# Altium schematic sheet 04_MCU_BLE.SchDoc
size A; SheetNumber: 3; SheetTotal: 6
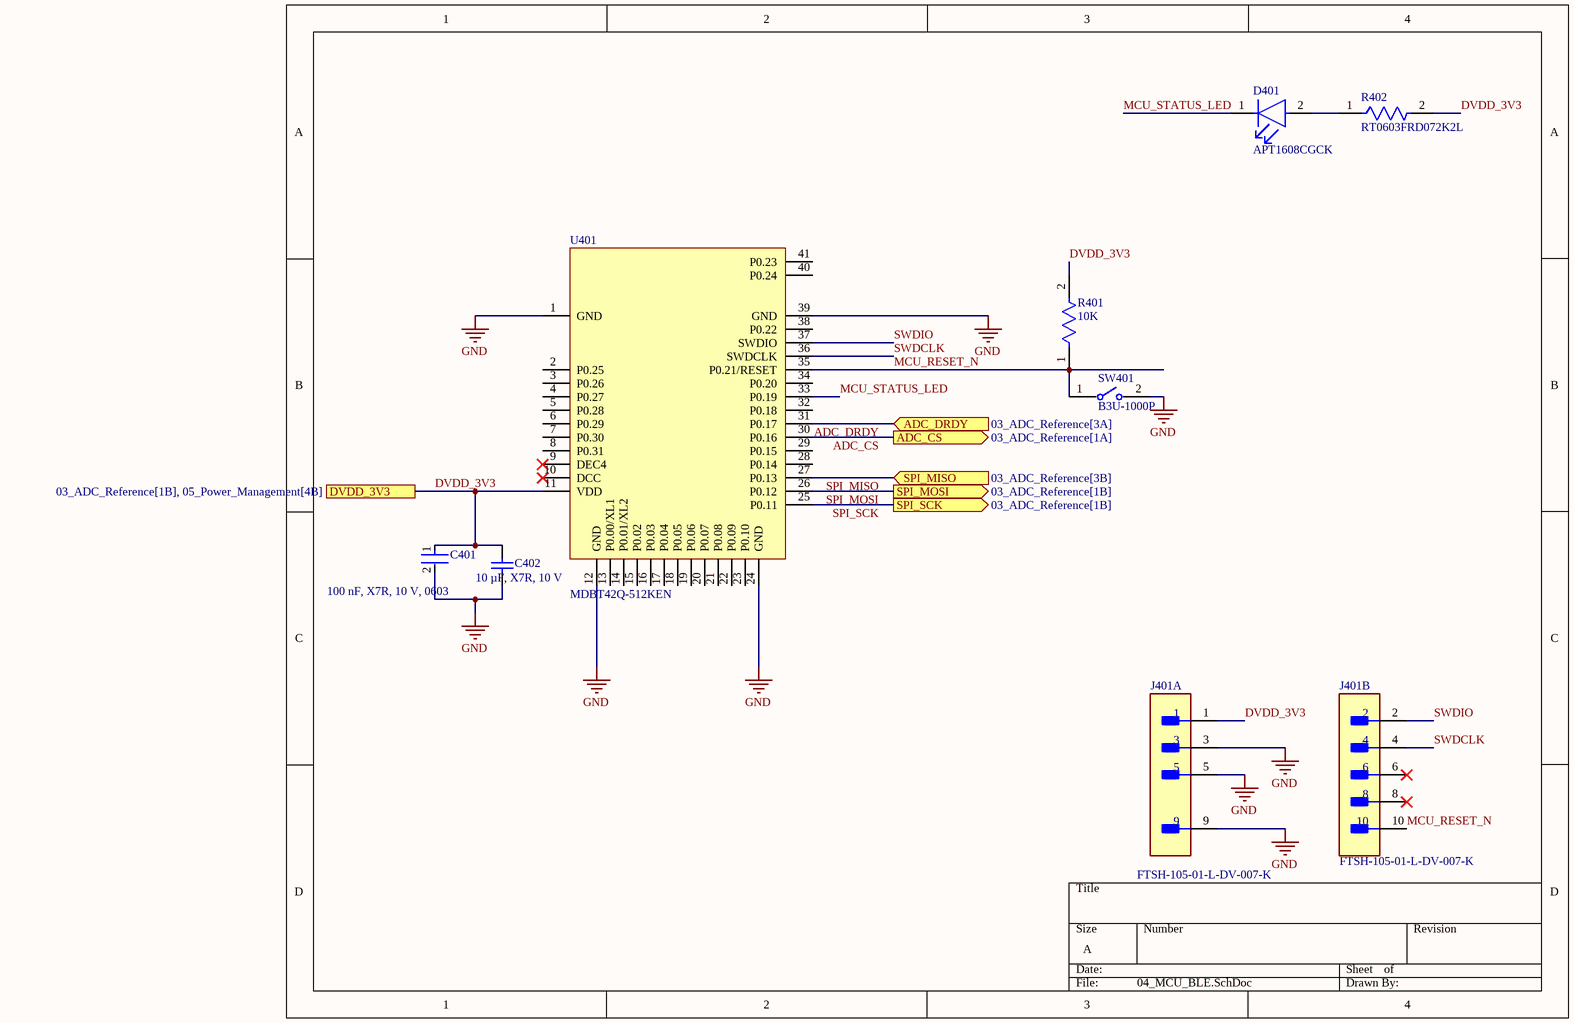
[diagram p0: 04_MCU_BLE.SchDoc]

## Parts
C401  100 nF, X7R, 10 V, 0603  [FP-CC0603-DA-MFG]
C402  10 µF, X7R, 10 V  [CAPC1206(3216)190_N]
D401  APT1608CGCK  [FP-APT1608CGCK-MFG]
J401  FTSH-105-01-L-DV-007-K  [FP-FTSH-105-01-L-DV-007-K-MFG]  (parts A,B of 2)
R401  10K  [FP-AC0603-IPC_C]
R402  RT0603FRD072K2L  [FP-RT0603-MFG]
SW401  B3U-1000P  [FP-B3U-1000P-MFG]
U401  MDBT42Q-512KEN  [MDBT42Q]

## Ports
ADC_CS (out, see 03_ADC_Reference[1A]), ADC_DRDY (in, see 03_ADC_Reference[3A]), DVDD_3V3 (see 03_ADC_Reference[1B], 05_Power_Management[4B]), SPI_MISO (in, see 03_ADC_Reference[3B]), SPI_MOSI (out, see 03_ADC_Reference[1B]), SPI_SCK (out, see 03_ADC_Reference[1B])

## Nets
GND: C401.2 C402.1 J401.3 J401.5 J401.9 SW401.2 U401.1(GND) U401.12(GND) U401.24(GND) U401.39(GND)
ADC_CS: U401.30(P0.16) ; port ADC_CS
ADC_DRDY: U401.31(P0.17) ; port ADC_DRDY
DVDD_3V3: C401.1 C402.2 J401.1 R401.2 R402.2 U401.11(VDD) ; port DVDD_3V3
MCU_RESET_N: J401.10 R401.1 SW401.1 U401.35(P0.21/RESET)
MCU_STATUS_LED: D401.1(C) U401.33(P0.19)
SPI_MISO: U401.27(P0.13) ; port SPI_MISO
SPI_MOSI: U401.26(P0.12) ; port SPI_MOSI
SPI_SCK: U401.25(P0.11) ; port SPI_SCK
SWDCLK: J401.4 U401.36(SWDCLK)
SWDIO: J401.2 U401.37(SWDIO)
NetD401_2: D401.2(A) R402.1

Not connected (* = marked no-connect by the designer): J401 6* 8*; U401 2(P0.25) 3(P0.26) 4(P0.27) 5(P0.28) 6(P0.29) 7(P0.30) 8(P0.31) 9(DEC4)* 10(DCC)* 13(P0.00/XL1) 14(P0.01/XL2) 15(P0.02) 16(P0.03) 17(P0.04) 18(P0.05) 19(P0.06) 20(P0.07) 21(P0.08) 22(P0.09) 23(P0.10) 28(P0.14) 29(P0.15) 32(P0.18) 34(P0.20) 38(P0.22) 40(P0.24) 41(P0.23)

## Library data of the parts
C401 = CMP-03422-001228-1: CAP CER 0.1UF 10V X7R 0603; Manufacturer Part Number: CC0603KRX7R6BB104; Manufacturer: YAGEO; Material: Ceramic; Tolerance: 0.1; Capacitance: 100 nF; Temperature Coefficient: 15%; Value: 100 nF; Height: 0.9mm; RoHS: TRUE; Footprint Url: http://www.yageo.com/exep/pages/download/literatures/UPY-C_GEN_24.pdf; Octopart: https://octopart.com/cc0603krx7r6bb104-yageo-9291607; Device Class L1: Passive Components; Mouser Description: 0603 0.1 uF 10 V ±10 % Tolerance X7R SMT Multilayer Ceramic Capacitor; ComponentLink2URL: http://www.yageo.com/documents/recent/UPY-GPHC_X7R_6.3V-to-50V_18.pdf; Automotive: No; Voltage: 10 V; Device Class L3: Ceramic Capacitors; Category: Cap; Temperature: -55°C to +125°C; ComponentLink2Description: Datasheet; Voltage Rating: 10 V; Device Class L2: Capacitors; Lead Free: Yes; Temperature Range High: +125°C; Temperature Range Low: -55°C; Digikey Description: CAP CER 0.1UF 10V X7R 0603; Package: CC0603-DA; Temperature Characteristic: X7R
C402 = CMP-1037-04966-1: CAP 10uF 10V ±5% 1206 (3216 Metric) Thickness 1.9mm SMD; Case-Metric: 3216; Case-EIA: 1206; Tolerance: Â±5%; Max Thickness: 1.9 mm; Value: 10uF; Rated Voltage: 10 V; Technology: SMT
D401 = CMP-44529-000032-1: LED GREEN CLEAR CHIP SMD; Luminous Intensity: 50mcd; Voltage: 3V; Forward Voltage: 2.1V; Forward Current: 20mA; Dominant Wavelength: 570nm; Power Rating: 75mW; Number of LEDs: 1; Viewing Angle: 120°; Number of Pins: 2; Packaging: Tape and Reel; Min Operating Temperature: -40°C; Length: 1.6mm; Width: 0.8mm; Mount: Surface Mount; Case/Package: 0603; Lead Free: Lead Free; Lens Color: Clear; Lens Style: Clear; Illumination Color: Green; Case Code (Imperial): 0603; Max Operating Temperature: 85°C; Height: 0.75mm; Case Code (Metric): 1608; Color: Green; Package Quantity: 2000; Test Current: 20mA
J401 = CMP-02766-000093-1: CONN HEADER SMD 10POS 1.27MM; Manufacturer: Samtec; Number Of Contacts: 9; Standoff Height: 0.2mm; Current Rating: 3.4A; Conn Orientation: Vertical; Conn Gender: Male; Device Class L3: unset; Manufacturer Part Number: FTSH-105-01-L-DV-007-K; Mouser Description: Conn Unshrouded Header HDR 10 POS 1.27mm Solder ST SMD Tube; Height: 6.38mm; RoHS: TRUE; Number Of Rows: 2; Footprint Url: http://suddendocs.samtec.com/prints/ftsh-1xx-xx-xxx-dv-xxx-footprint.pdf; Lead Free: Yes; Package: 0; Category: Conn; ComponentLink2URL: http://suddendocs.samtec.com/catalog_english/ftsh_smt.pdf; Automotive: No; ComponentLink2Description: Datasheet; Device Class L1: Connectors; Temperature: -55°C to +125°C; Digikey Description: CONN HEADER SMD 10POS 1.27MM; Device Class L2: Headers and Wire Housings; Temperature Range High: +125°C; Octopart: https://octopart.com/ftsh-105-01-l-dv-007-k-samtec-53647300; Contact Material: Gold,Nickel; Temperature Range Low: -55°C; Pitch: 1.27mm
R401 = CMP-03412-008483-2: RES 10KΩ 1.00% 0.1W 0603, AC0603FR-1310KL; Resistance: 10kR; Tolerance: 1%; RoHS Compliant: Yes; Lead Free: Lead Free; Case/Package: 0603
R402 = CMP-03412-026926-1: RES SMD 2.2K OHM 1% 1/10W 0603; Manufacturer: Yageo; Resistance: 2.2KΩ; Tolerance: 0.01; Power Rating: 0.1W; Voltage Rating: 75V; Value: 2.2KΩ; Temperature Coefficient: 25 ppm/°C; Footprint Url: http://www.yageo.com/exep/pages/download/literatures/PYu-R_Mount_10.pdf; ComponentLink2URL: http://www.yageo.com/documents/recent/PYu-RT_1-to-0.01_RoHS_L_9.pdf; Package: RT0603; Temperature: -55°C to +155°C; ComponentLink2Description: Datasheet; Device Class L2: Resistors; Digikey Description: RES SMD 2.2K OHM 1% 1/10W 0603; Composition: Thin Film; Temperature Range High: +155°C; Automotive: No; Temperature Range Low: -55°C; Manufacturer Part Number: RT0603FRD072K2L; Series: RT; RoHS: TRUE; Octopart: https://octopart.com/rt0603frd072k2l-yageo-71395345; Device Class L1: Passive Components; Ipc Land Pattern Name: RESC16080X45; Lead Free: Yes; Height: 0.55mm; Device Class L3: Chip SMD Resistors; Category: Res
SW401 = CMP-2100-03586-2: SWITCH TACTILE SPST-NO 0.05A 12V; Contact Resistance: 100mR; Operating Force: 1.5N; Max Current Rating: 50mA; Switch Travel: 0.15mm; Actuator Type: Standard; Mechanical Life: 200000Cycles; Ratings: Dust Proof; Illumination Type: Non-Illuminated; Throw Configuration: SPST; Actuator Length: 0.4mm; Switch Function: Off-Mom; Height: 1.2mm; Width: 3mm; Weight: 0.000776oz; Contact Material: Silver; Max Voltage Rating (DC): 12V; Insulation Resistance: 100MR; Lead Free: Lead Free; Current Rating: 50mA; Termination: SMD/SMT; Length: 4mm; Voltage Rating (DC): 12V; Contact Current Rating: 50mA; Orientation: Straight; Depth: 2.5mm; Max Operating Temperature: 70°C; Packaging: Tape and Reel; Min Operating Temperature: -25°C; Package Quantity: 1; Mount: Surface Mount; Electrical Life: 200000Cycles
U401 = MDBT42Q